# Altium project PWM.PrjPcb
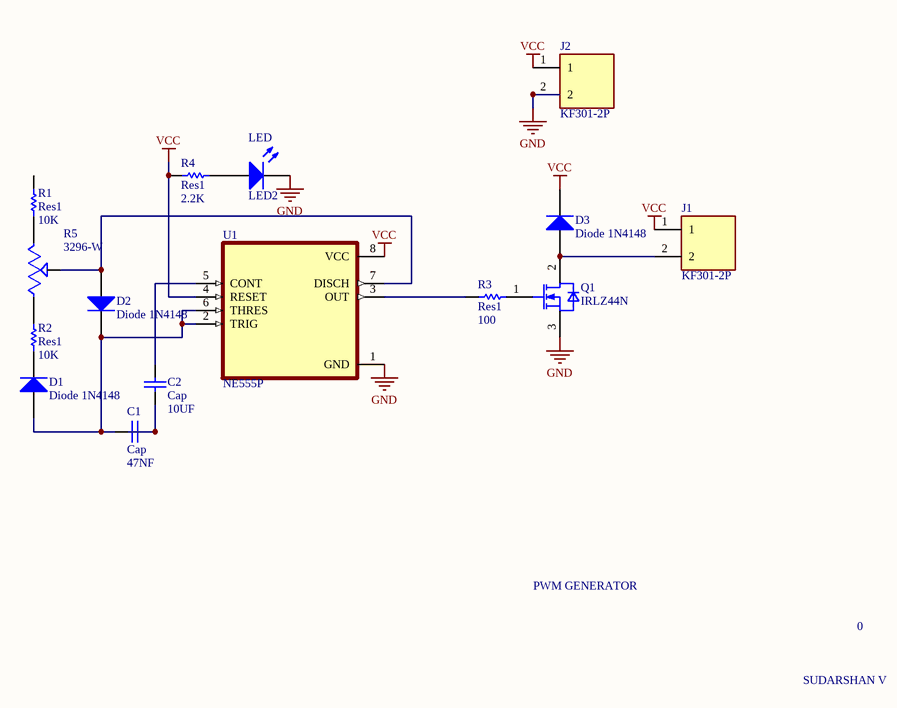
[diagram p0: PWM_schematic.SchDoc]
1 sheet, 15 parts. Net scope: global (net labels, ports and power ports of the same name join across sheets).
Board file: PWM.PcbDoc

## Sheet PWM_schematic.SchDoc
size A; SheetNumber: 1; SheetTotal: 1

### Parts
C1  Cap  value 47NF  [RAD-0.3]
C2  Cap  value 10UF  [RAD-0.3]
D1  Diode 1N4148  [DO-35]
D2  Diode 1N4148  [DO-35]
D3  Diode 1N4148  [DO-35]
J1  KF301-2P  [HANDSON_KF301-2P]
J2  KF301-2P  [HANDSON_KF301-2P]
LED  LED2  [3.2X1.6X1.1]
Q1  IRLZ44N
R1  Res1  value 10K  [AXIAL-0.3]
R2  Res1  value 10K  [AXIAL-0.3]
R3  Res1  value 100  [AXIAL-0.3]
R4  Res1  value 2.2K  [AXIAL-0.3]
R5  3296-W  [TRIM_3296-W]
U1  NE555P  [DIP794W45P254L959H508Q8]

### Nets
GND: J2.2 LED.2(K) Q1.3(SOURCE) U1.1(GND)
VCC: D3.2(K) J1.1 J2.1 R4.2 U1.4(RESET) U1.8(VCC)
NetC1_1: C1.1 D1.1(A) D2.2(K) U1.2(TRIG) U1.6(THRES)
NetC1_2: C1.2 C2.1
NetC2_2: C2.2 U1.5(CONT)
NetD2_1: D2.1(A) R5.2(WIPER) U1.7(DISCH)
NetD3_1: D3.1(A) J1.2 Q1.2(DRAIN)
NetLED_1: LED.1(A) R4.1
NetR1_1: R1.1 R5.3(CW)
NetR2_2: R2.2 R5.1(CCW)
NetR3_2: R3.2 U1.3(OUT)

Not connected (* = marked no-connect by the designer): D1 2(K); Q1 1(GATE); R1 2; R2 1; R3 1

### Notes on the sheet
- PWM GENERATOR
- 0
- SUDARSHAN V

### Library data of the parts
C1 C2 = Cap: Capacitor; Published: 8-Jun-2000; LatestRevisionDate: 17-Jul-2002; LatestRevisionNote: Re-released for DXP Platform.; PackageReference: RAD-0.3; Publisher: Altium Limited; PackageDescription: Radial Cap, Thru-Hole; 2 Leads; 0.3 in Pin Spacing
D1-D3 = Diode 1N4148: High Conductance Fast Diode; Published: 8-Jun-2000; LatestRevisionDate: 17-Jul-2002; LatestRevisionNote: Re-released for DXP Platform.; DatasheetVersion: 1997; PackageReference: DO-35; Publisher: Altium Limited; PackageDescription: Diode, Axial; Body 3.8 x 1.9 mm (LxDia. max), Lead Dia. 0.53 mm (max); Code_JEDEC: DO-204-AH; ComponentLink1Description: Manufacturer Link; ComponentLink1URL: http://www.fairchildsemi.com/; ComponentLink2Description: Datasheet; ComponentLink2URL: http://www.fairchildsemi.com/ds/1N%2F1N4148.pdf
J1 J2 = KF301-2P: 2 Pin Terminal Block 5mm Pitch; MF: Handson Technology; SnapEDA_Link: https://www.snapeda.com/parts/KF301-2P/Handson+Technology/view-part/?ref=snap; Package: None; Value: *; MP: KF301-2P; Check_prices: https://www.snapeda.com/parts/KF301-2P/Handson+Technology/view-part/?ref=eda
LED = LED2: Typical RED, GREEN, YELLOW, AMBER GaAs LED; Published: 8-Jun-2000; LatestRevisionDate: 17-Jul-2002; LatestRevisionNote: Re-released for DXP Platform.; PackageVersion: Feb-2002; PackageReference: 3.2X1.6X1.1; Publisher: Altium Limited; PackageDescription: SM LED; 2 Flat Leads
Q1 = IRLZ44N: OptiMOS 3 Power-Transistor, VDS 100V; Manufacturer: Infineon Technologies; Manufacturer Order Number: IRLZ44N; PackageReference: PG-TO220-3-904
R1-R4 = Res1: Resistor; Published: 8-Jun-2000; LatestRevisionDate: 17-Jul-2002; LatestRevisionNote: Re-released for DXP Platform.; PackageReference: AXIAL-0.3; Publisher: Altium Limited; PackageDescription: Axial Device, Thru-Hole; 2 Leads; 0.3 in Pin Spacing
R5 = 3296-W: Res Cermet Trimmer 2K Ohm 10% 0.5W(1/2W) 25(Elec)Turns 2.19mm (9.53 X 4.83 X 11.55mm) Pin Thru-Hole Tube; MF: Bourns; MP: 3296W; SnapEDA_Link: https://www.snapeda.com/parts/3296W/Bourns/view-part/?ref=snap; Package: NON STANDARD-3 Bourns; Value: *; Check_prices: https://www.snapeda.com/parts/3296W/Bourns/view-part/?ref=eda
U1 = NE555P: Single Precision Timer; MF: Texas Instruments; SnapEDA_Link: https://www.snapeda.com/parts/NE555P/Texas+Instruments/view-part/?ref=snap; Package: PDIP-8 Texas; Value: *; MP: NE555P; Check_prices: https://www.snapeda.com/parts/NE555P/Texas+Instruments/view-part/?ref=eda